# EasyEDA Pro project Rear_ESP32S3_R26.epro, schematic Front_Optical_PAT9125_V0.1
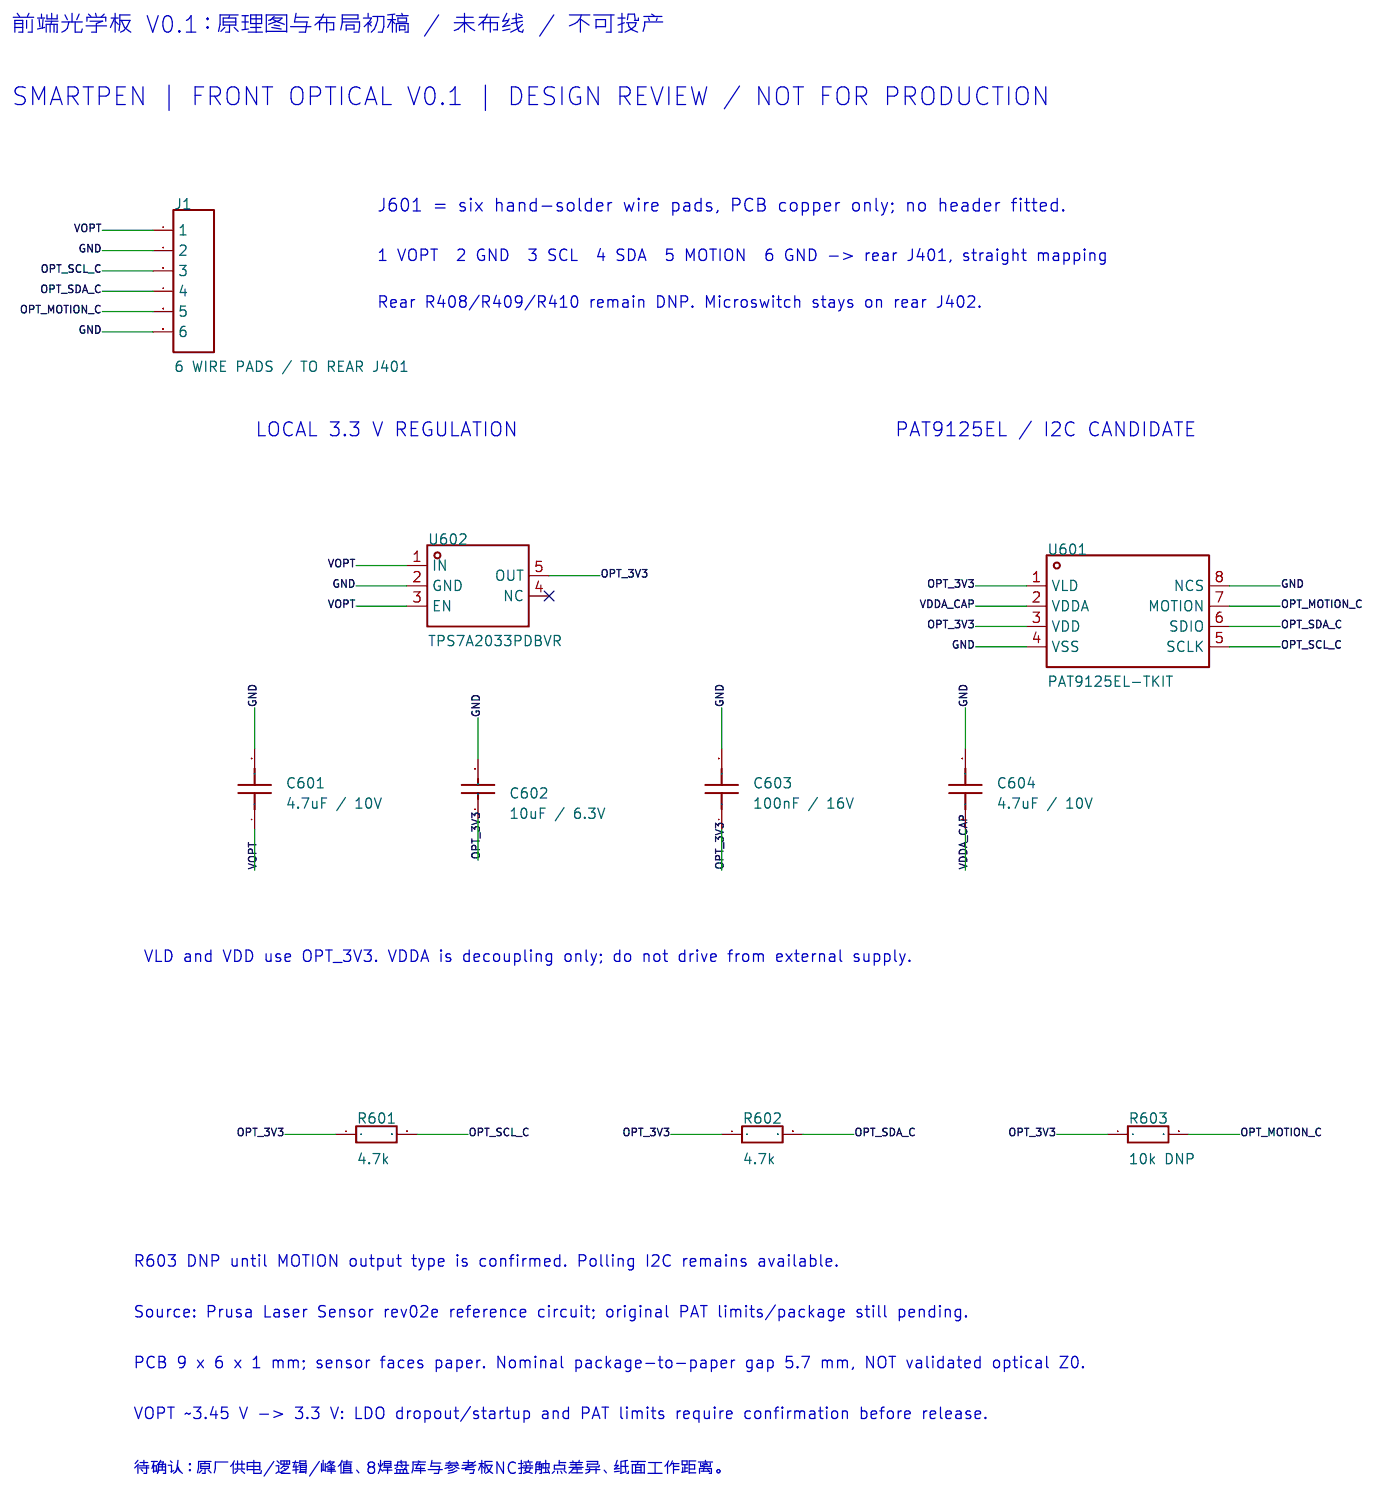
[diagram p5: schematic sheet]

## Parts
C601  4.7uF  [C0402]
C602  10uF  [C0402]
C603  100nF  [C0402]
C604  4.7uF  [C0402]
J1  6 WIRE PADS / TO REAR J401  [HDR-TH_6P-P2.54-V-M-1]  (no BOM)
R601  4.7kΩ  [R0402]
R602  4.7kΩ  [R0402]
R603  10kΩ  [R0402]  (no BOM)
U601  PAT9125EL-TKIT  [LGA-8_L3.5-W3.2-P0.80-BL]
U602  TPS7A2033PDBVR  [SOT-23-5_L2.9-W1.6-P0.95-LS2.8-BR]

## Library data of the parts
C601 C604 = CL05A475MP5NRNC: 容值:4.7uF;精度:±20%;额定电压:10V;温度系数:X5R;; LCSC Part Name: 4.7uF ±20% 10V; Supplier Part: C23733; Manufacturer: SAMSUNG(三星); Supplier Footprint: 0402; JLCPCB Part Class: Basic Part; Datasheet: https://item.szlcsc.com/datasheet/CL05A475MP5NRNC/24469.html; Supplier: LCSC; Tolerance: ±20%; Voltage Rating: 10V; Temperature Coefficient: X5R; PCB Layer: Default; Assembly: FIT; Review: Engineering design; PAT supplier optical/electrical document pending
C602 = CL05A106MQ5NUNC: 容值:10uF;精度:±20%;额定电压:6.3V;温度系数:X5R;; LCSC Part Name: 10uF ±20% 6.3V; Supplier Part: C15525; Manufacturer: SAMSUNG(三星); Supplier Footprint: 0402; JLCPCB Part Class: Basic Part; Datasheet: https://item.szlcsc.com/datasheet/CL05A106MQ5NUNC/16204.html; Supplier: LCSC; Tolerance: ±20%; Voltage Rating: 6.3V; Temperature Coefficient: X5R; PCB Layer: Default; Assembly: FIT; Review: Engineering design; PAT supplier optical/electrical document pending
C603 = CL05B104KO5NNNC: 容值:100nF;精度:±10%;额定电压:16V;温度系数:X7R;; LCSC Part Name: 100nF ±10% 16V; Supplier Part: C1525; Manufacturer: SAMSUNG(三星); Supplier Footprint: 0402; JLCPCB Part Class: Basic Part; Datasheet: https://item.szlcsc.com/datasheet/CL05B104KO5NNNC/1877.html; Supplier: LCSC; Tolerance: ±10%; Voltage Rating: 16V; Temperature Coefficient: X7R; PCB Layer: Default; Assembly: FIT; Review: Engineering design; PAT supplier optical/electrical document pending
J1 = HDR-M_2.54_1x6P: Supplier Part: C37208; Supplier Footprint: 插件; PCB Layer: Default; Assembly: PCB_ONLY_INTERFACE; Review: Engineering design; PAT supplier optical/electrical document pending
R601 R602 = 0402WGF4701TCE: 电阻类型:厚膜电阻;阻值:4.7kΩ;精度:±1%;功率:62.5mW;工作电压:50V;温度系数:±100ppm/℃;; LCSC Part Name: 厚膜电阻 4.7kΩ ±1%; Supplier Part: C25900; Manufacturer: UNI-ROYAL(厚声); Supplier Footprint: 0402; JLCPCB Part Class: Basic Part; Datasheet: https://item.szlcsc.com/datasheet/0402WGF4701TCE/26643.html; Supplier: LCSC; Type: 厚膜电阻; Tolerance: ±1%; Power(Watts): 62.5mW; Voltage-Supply(Max): 50V; Temperature Coefficient: ±100ppm/℃; Operating Temperature: -55℃~+155℃; PCB Layer: Default; Assembly: FIT; Review: Engineering design; PAT supplier optical/electrical document pending
R603 = 0402WGF1002TCE: 电阻类型:厚膜电阻;阻值:10kΩ;精度:±1%;功率:62.5mW;工作电压:50V;温度系数:±100ppm/℃;; LCSC Part Name: 厚膜电阻 10kΩ ±1%; Supplier Part: C25744; Manufacturer: UNI-ROYAL(厚声); Supplier Footprint: 0402; JLCPCB Part Class: Basic Part; Datasheet: https://item.szlcsc.com/datasheet/0402WGF1002TCE/26487.html; Supplier: LCSC; Type: 厚膜电阻; Tolerance: ±1%; Power(Watts): 62.5mW; Voltage-Supply(Max): 50V; Temperature Coefficient: ±100ppm/℃; Operating Temperature: -55℃~+155℃
U601 = PAT9125EL-TKIT: Supplier Part: C2832657; Supplier Footprint: LGA-8(3.2x3.5x0.8mm); JLCPCB Part Class: Extended Part; Supplier: LCSC; PCB Layer: Default; Assembly: FIT; Review: Engineering design; PAT supplier optical/electrical document pending
U602 = TPS7A2033PDBVR: 输出极性:正极;工作电压:6V;输出电压:3.3V;输出电流:300mA;电源纹波抑制比(PSRR):65dB@(100kHz);输出类型:固定;; LCSC Part Name: 3.3V 300mA 6V; Supplier Part: C2862740; Manufacturer: TI(德州仪器); Supplier Footprint: SOT-23-5; JLCPCB Part Class: Extended Part; Datasheet: https://www.ti.com/cn/lit/ds/symlink/tps7a20.pdf; Supplier: LCSC; Output Configuration: 正极; Voltage - Supply: 6V; Output Voltage: 3.3V; Output Current: 300mA; Power Supply Rejection Ratio (PSRR): 65dB@(100kHz); Voltage Dropout: 140mV@(300mA); standby current: 8.5uA; Noise: 10uVrms; Features: 使能控制；内置软启动；过流保护；短路保护；输出放电；热关断；输入欠压保护; Operating Temperature: -40℃~+125℃@(Tj); Output Type: 固定; Number of Outputs: 1; PCB Layer: Default; Assembly: FIT; Review: Engineering design; PAT supplier optical/electrical document pending

## Nets
GND: C601.2 C602.2 C603.2 C604.2 J1.2 J1.6 U601.4(VSS) U601.8(NCS) U602.2(GND)
VDDA_CAP: C604.1 U601.2(VDDA)
OPT_3V3: C602.1 C603.1 R601.1 R602.1 R603.1 U601.1(VLD) U601.3(VDD) U602.5(OUT)
OPT_MOTION_C: J1.5 R603.2 U601.7(MOTION)
OPT_SCL_C: J1.3 R601.2 U601.5(SCLK)
OPT_SDA_C: J1.4 R602.2 U601.6(SDIO)
VOPT: C601.1 J1.1 U602.1(IN) U602.3(EN)

Not connected (* = marked no-connect by the designer): U602 4(NC)*

## Notes on the sheet
- 前端光学板 V0.1：原理图与布局初稿 / 未布线 / 不可投产
- SMARTPEN | FRONT OPTICAL V0.1 | DESIGN REVIEW / NOT FOR PRODUCTION
- J601 = six hand-solder wire pads, PCB copper only; no header fitted.
- 1 VOPT  2 GND  3 SCL  4 SDA  5 MOTION  6 GND -> rear J401, straight mapping
- Rear R408/R409/R410 remain DNP. Microswitch stays on rear J402.
- LOCAL 3.3 V REGULATION
- PAT9125EL / I2C CANDIDATE
- VLD and VDD use OPT_3V3. VDDA is decoupling only; do not drive from external supply.
- R603 DNP until MOTION output type is confirmed. Polling I2C remains available.
- Source: Prusa Laser Sensor rev02e reference circuit; original PAT limits/package still pending.
- PCB 9 x 6 x 1 mm; sensor faces paper. Nominal package-to-paper gap 5.7 mm, NOT validated optical Z0.
- VOPT ~3.45 V -> 3.3 V: LDO dropout/startup and PAT limits require confirmation before release.
- 待确认：原厂供电/逻辑/峰值、8焊盘库与参考板NC接触点差异、纸面工作距离。
